# Altium project Control-Boards-v2.0.PrjPcb (part 8 of 10)

## Sheet Buttons-Lights-Sensors-Sheet.SchDoc
size 420 x 297 mm; SheetNumber: 12; SheetTotal: 15
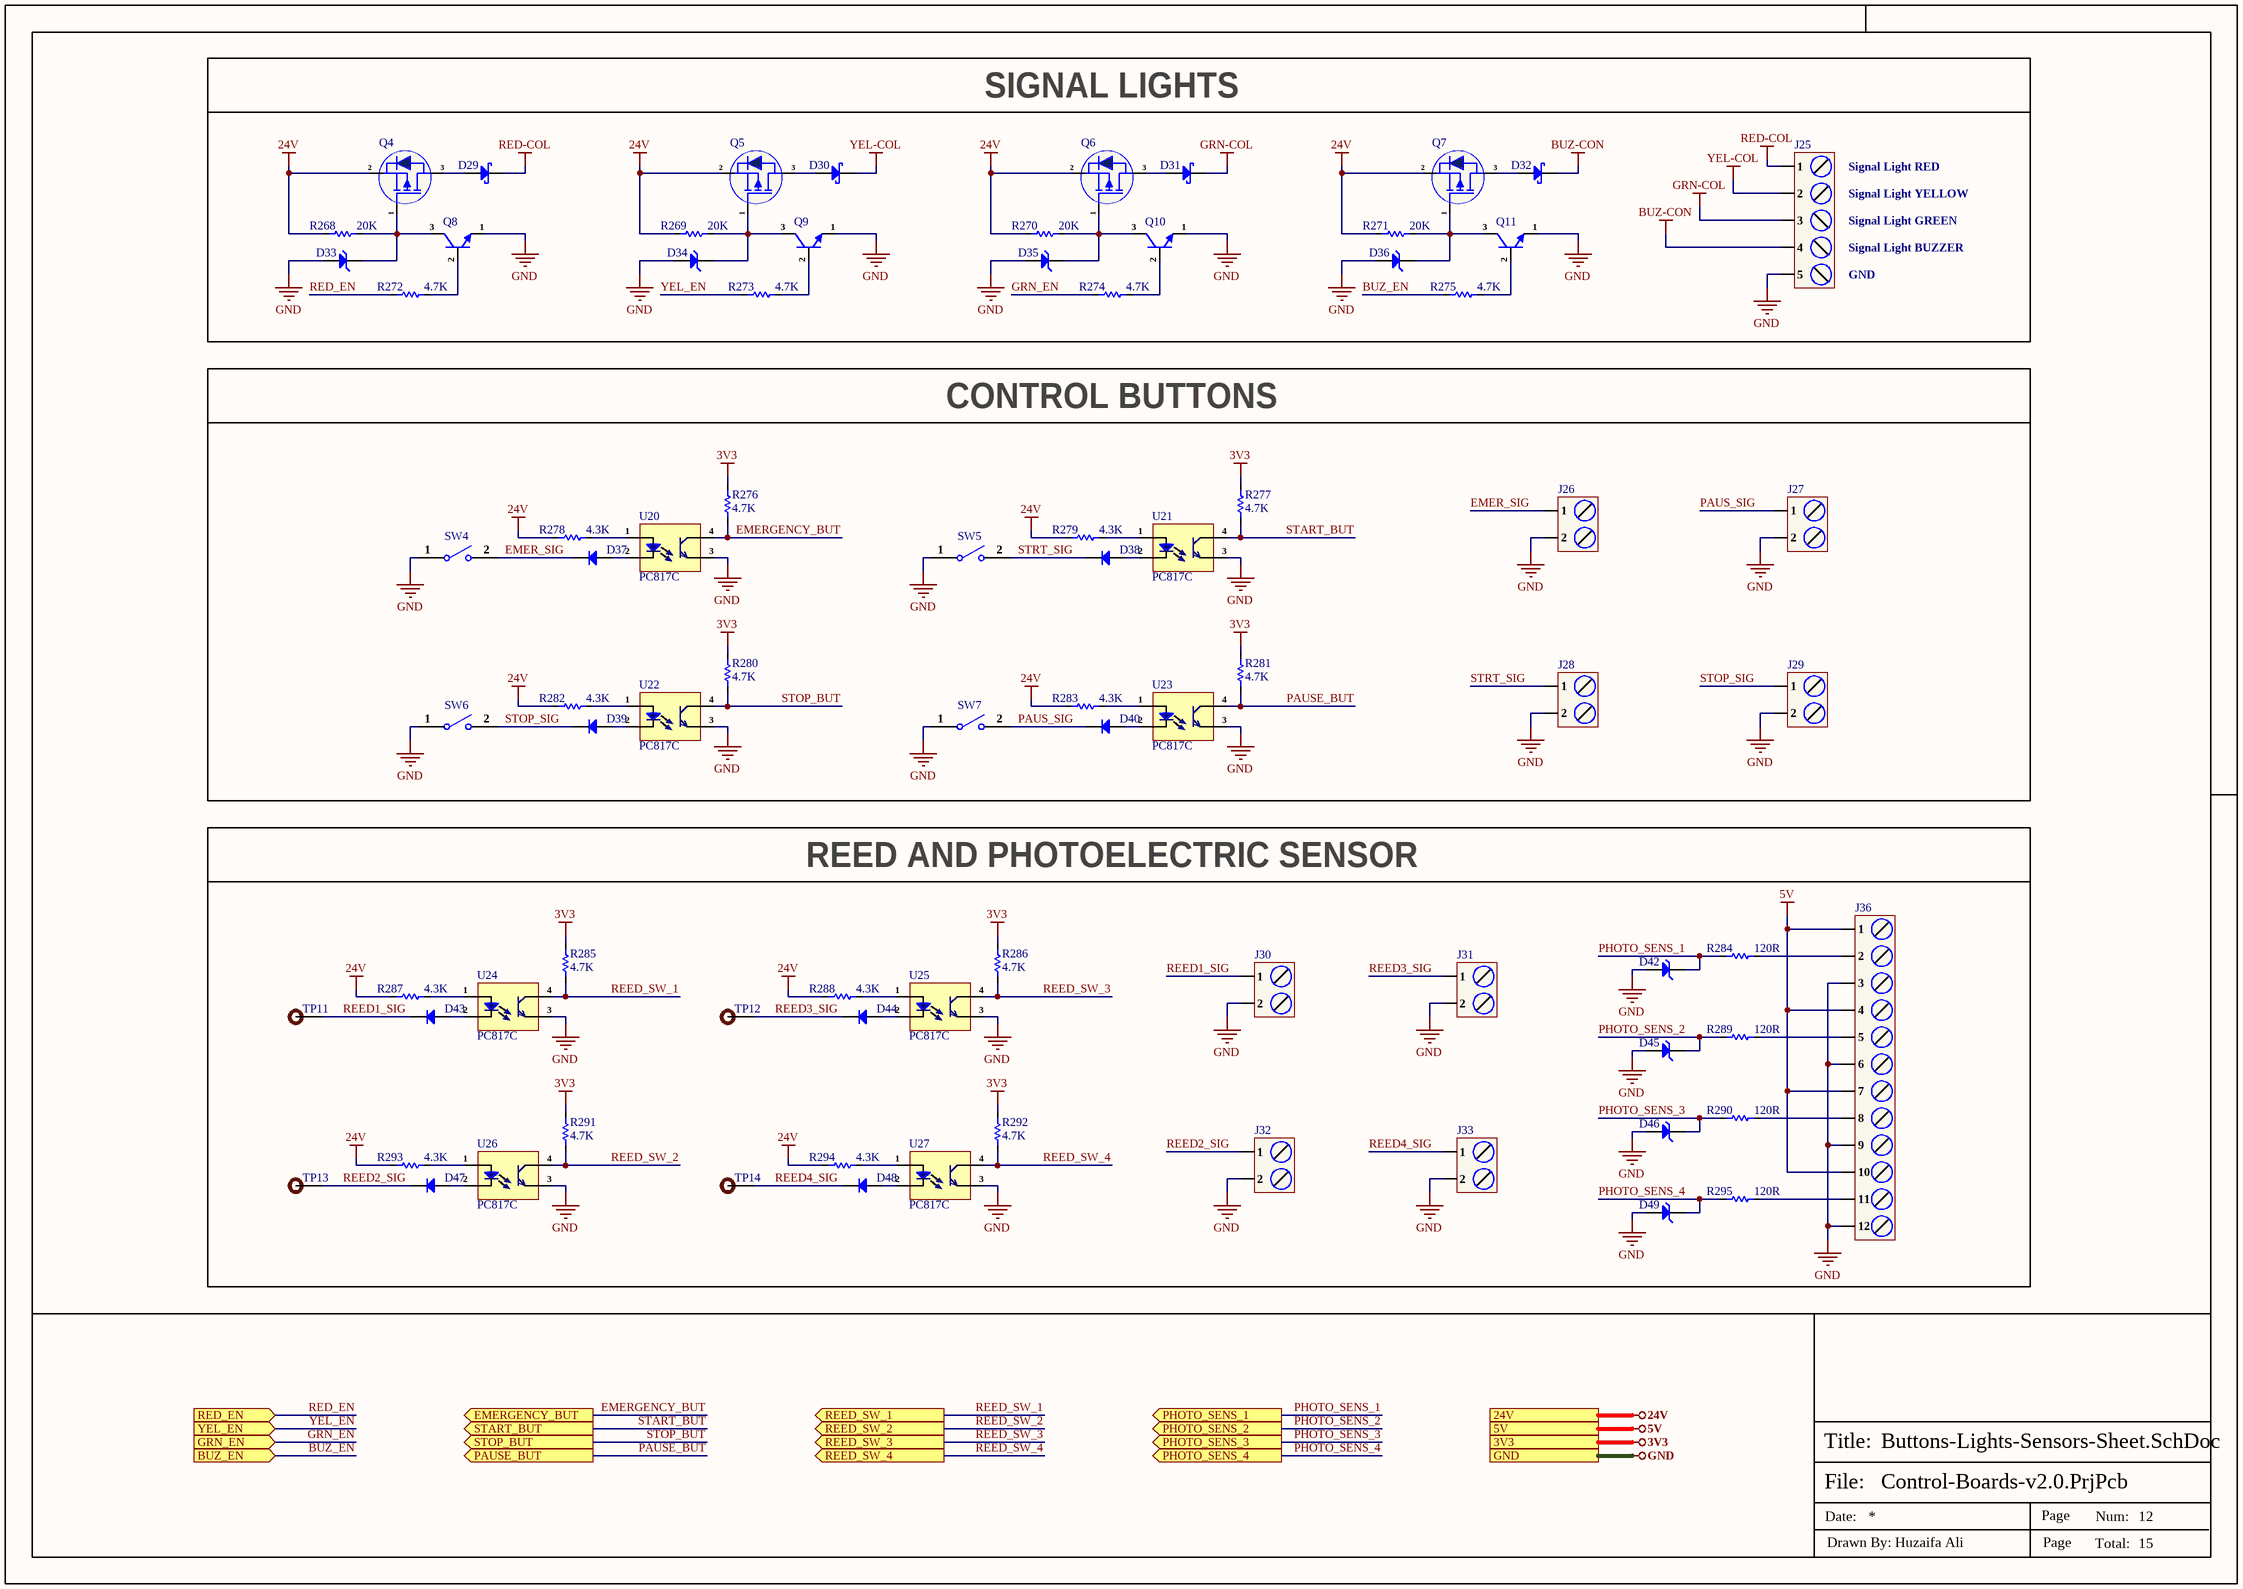
[diagram p12: Buttons-Lights-Sensors-Sheet.SchDoc]

### Parts
D29  SS16  [SMA]  (value not drawn)
D30  SS16  [SMA]  (value not drawn)
D31  SS16  [SMA]  (value not drawn)
D32  SS16  [SMA]  (value not drawn)
D33  1SMA5930BT3G  [SMA]  (value not drawn)
D34  1SMA5930BT3G  [SMA]  (value not drawn)
D35  1SMA5930BT3G  [SMA]  (value not drawn)
D36  1SMA5930BT3G  [SMA]  (value not drawn)
D37  1N4148W-7-F  [SOD-123]  (value not drawn)
D38  1N4148W-7-F  [SOD-123]  (value not drawn)
D39  1N4148W-7-F  [SOD-123]  (value not drawn)
D40  1N4148W-7-F  [SOD-123]  (value not drawn)
D42  MM3Z3V3B  [SOD323F]  (value not drawn)
D43  1N4148W-7-F  [SOD-123]  (value not drawn)
D44  1N4148W-7-F  [SOD-123]  (value not drawn)
D45  MM3Z3V3B  [SOD323F]  (value not drawn)
D46  MM3Z3V3B  [SOD323F]  (value not drawn)
D47  1N4148W-7-F  [SOD-123]  (value not drawn)
D48  1N4148W-7-F  [SOD-123]  (value not drawn)
D49  MM3Z3V3B  [SOD323F]  (value not drawn)
J25  DB128V-5.08-5P-GN-S  [DB128V-5.08-5P-GN-S]  (value not drawn)
J26  DB128L-5.08-2P-OG-S  [DB128L-5.08-2P-OG-S]  (value not drawn)
J27  DB128L-5.08-2P-GY-S  [DB128L-5.08-2P-GY-S]  (value not drawn)
J28  DB128L-5.08-2P-GN-S  [DB128L-5.08-2P-GN-S]  (value not drawn)
J29  DB128L-5.08-2P-BK-S  [DB128L-5.08-2P-BK-S]  (value not drawn)
J30  DB128L-5.08-2P-OG-S  [DB128L-5.08-2P-OG-S]  (value not drawn)
J31  DB128L-5.08-2P-GY-S  [DB128L-5.08-2P-GY-S]  (value not drawn)
J32  DB128L-5.08-2P-GN-S  [DB128L-5.08-2P-GN-S]  (value not drawn)
J33  DB128L-5.08-2P-BK-S  [DB128L-5.08-2P-BK-S]  (value not drawn)
J36  DB128V-5.08-12P-GN-S  [DB128V-5.08-12P-GN-S]  (value not drawn)
Q4  AO3401  [SOT-23]  (value not drawn)
Q5  AO3401  [SOT-23]  (value not drawn)
Q6  AO3401  [SOT-23]  (value not drawn)
Q7  AO3401  [SOT-23]  (value not drawn)
Q8  MMBT3904  [SOT-23]  (value not drawn)
Q9  MMBT3904  [SOT-23]  (value not drawn)
Q10  MMBT3904  [SOT-23]  (value not drawn)
Q11  MMBT3904  [SOT-23]  (value not drawn)
R268  20K  [Res-0402]
R269  20K  [Res-0402]
R270  20K  [Res-0402]
R271  20K  [Res-0402]
R272  4.7K  [Res-0402]
R273  4.7K  [Res-0402]
R274  4.7K  [Res-0402]
R275  4.7K  [Res-0402]
R276  4.7K  [Res-0402]
R277  4.7K  [Res-0402]
R278  4.3K  [Res-0402]
R279  4.3K  [Res-0402]
R280  4.7K  [Res-0402]
R281  4.7K  [Res-0402]
R282  4.3K  [Res-0402]
R283  4.3K  [Res-0402]
R284  120R  [Res-0603]
R285  4.7K  [Res-0402]
R286  4.7K  [Res-0402]
R287  4.3K  [Res-0402]
R288  4.3K  [Res-0402]
R289  120R  [Res-0603]
R290  120R  [Res-0603]
R291  4.7K  [Res-0402]
R292  4.7K  [Res-0402]
R293  4.3K  [Res-0402]
R294  4.3K  [Res-0402]
R295  120R  [Res-0603]
SW4  B3U-1000P  [B3U-1000P]  (value not drawn)
SW5  B3U-1000P  [B3U-1000P]  (value not drawn)
SW6  B3U-1000P  [B3U-1000P]  (value not drawn)
SW7  B3U-1000P  [B3U-1000P]  (value not drawn)
TP11  TEST POINT  [Test-point]  (value not drawn)  (no BOM)
TP12  TEST POINT  [Test-point]  (value not drawn)  (no BOM)
TP13  TEST POINT  [Test-point]  (value not drawn)  (no BOM)
TP14  TEST POINT  [Test-point]  (value not drawn)  (no BOM)
U20  PC817C  [PC817C]
U21  PC817C  [PC817C]
U22  PC817C  [PC817C]
U23  PC817C  [PC817C]
U24  PC817C  [PC817C]
U25  PC817C  [PC817C]
U26  PC817C  [PC817C]
U27  PC817C  [PC817C]

### Blocks framed on the sheet
SIGNAL LIGHTS: D29-D36 J25 Q4-Q11 R268-R275
CONTROL BUTTONS: D37-D40 J26-J29 R276-R283 SW4-SW7 U20-U23
REED AND PHOTOELECTRIC SENSOR: D42-D49 J30-J33 J36 R284-R295 TP11-TP14 U24-U27

### Ports
3V3 (see Top-Sheet[5B], CAN-Sheet[5D], Controller-Sheet-1[4D], Controller-Sheet-2[4D], EtherCAT-Sheet[1D], Ethernet-PHY-Sheet[4D], Power-Sheet[4D], RS232-Sheet[5D], RS485-Sheet[5D], USB-Sheet[4D], VFD-Support-Sheet[4D]), 5V (see Top-Sheet[5B], CAN-Sheet[5D], Controller-Sheet-2[4D], Power-Sheet[4D], RS232-Sheet[5D], RS485-Sheet[5D], USB-Sheet[4D], VFD-Support-Sheet[4D]), 24V (see Top-Sheet[5B], Power-Sheet[4D]), BUZ_EN (in, see Top-Sheet[5C]), EMERGENCY_BUT (out, see Top-Sheet[5C]), GND (see Top-Sheet[5C], CAN-Sheet[6D], Controller-Sheet-1[4D], Controller-Sheet-2[4D], Controller-Sheet-3[4D], EtherCAT-Sheet[1D], Ethernet-PHY-Sheet[4D], Extra-DIOs[4D], Power-Sheet[4D], RS232-Sheet[5D], RS485-Sheet[5D], USB-Sheet[4D], VFD-Support-Sheet2[4D], VFD-Support-Sheet[4D]), GRN_EN (in, see Top-Sheet[5C]), PAUSE_BUT (out, see Top-Sheet[5C]), PHOTO_SENS_1 (out, see Top-Sheet[5C]), PHOTO_SENS_2 (out, see Top-Sheet[5C]), PHOTO_SENS_3 (out, see Top-Sheet[5C]), PHOTO_SENS_4 (out, see Top-Sheet[5C]), RED_EN (in, see Top-Sheet[5C]), REED_SW_1 (out, see Top-Sheet[5C]), REED_SW_2 (out, see Top-Sheet[5C]), REED_SW_3 (out, see Top-Sheet[5C]), REED_SW_4 (out, see Top-Sheet[5C]), START_BUT (out, see Top-Sheet[5C]), STOP_BUT (out, see Top-Sheet[5C]), YEL_EN (in, see Top-Sheet[5C])

### Nets
3V3: R276.2 R277.2 R280.2 R281.2 R285.2 R286.2 R291.2 R292.2 ; port 3V3
5V: J36.1 J36.4 J36.7 J36.10 ; port 5V
24V: Q4.2(S) Q5.2(S) Q6.2(S) Q7.2(S) R268.1 R269.1 R270.1 R271.1 R278.1 R279.1 R282.1 R283.1 R287.1 R288.1 R293.1 R294.1 ; port 24V
BUZ-CON: D32.1(K) J25.4
GND: D33.2(A) D34.2(A) D35.2(A) D36.2(A) D42.1(A) D45.1(A) D46.1(A) D49.1(A) J25.5 J26.2 J27.2 J28.2 J29.2 J30.2 J31.2 J32.2 J33.2 J36.3 J36.6 J36.9 J36.12 Q8.1(E) Q9.1(E) Q10.1(E) Q11.1(E) SW4.1 SW5.1 SW6.1 SW7.1 U20.3(E) U21.3(E) U22.3(E) U23.3(E) U24.3(E) U25.3(E) U26.3(E) U27.3(E) ; port GND
GRN-COL: D31.1(K) J25.3
RED-COL: D29.1(K) J25.1
YEL-COL: D30.1(K) J25.2
BUZ_EN: R275.1 ; port BUZ_EN
EMER_SIG: D37.2(K) J26.1 SW4.2
EMERGENCY_BUT: R276.1 U20.4(C) ; port EMERGENCY_BUT  [project net DI_PE9]
GRN_EN: R274.1 ; port GRN_EN  [project net DO_PD14]
PAUS_SIG: D40.2(K) J27.1 SW7.2
PAUSE_BUT: R281.1 U23.4(C) ; port PAUSE_BUT  [project net DI_PE10]
PHOTO_SENS_1: D42.2(K) R284.1 ; port PHOTO_SENS_1  [project net DI_PG1]
PHOTO_SENS_2: D45.2(K) R289.1 ; port PHOTO_SENS_2  [project net DI_PG2]
PHOTO_SENS_3: D46.2(K) R290.1 ; port PHOTO_SENS_3  [project net DI_PG3]
PHOTO_SENS_4: D49.2(K) R295.1 ; port PHOTO_SENS_4  [project net DI_PG4]
RED_EN: R272.1 ; port RED_EN  [project net DO_PF13]
REED1_SIG: D43.2(K) J30.1 TP11.1
REED2_SIG: D47.2(K) J32.1 TP13.1
REED3_SIG: D44.2(K) J31.1 TP12.1
REED4_SIG: D48.2(K) J33.1 TP14.1
REED_SW_1: R285.1 U24.4(C) ; port REED_SW_1  [project net DI_PG0]
REED_SW_2: R291.1 U26.4(C) ; port REED_SW_2  [project net DI_PE13]
REED_SW_3: R286.1 U25.4(C) ; port REED_SW_3  [project net DI_PE14]
REED_SW_4: R292.1 U27.4(C) ; port REED_SW_4  [project net DI_PE15]
START_BUT: R277.1 U21.4(C) ; port START_BUT  [project net DI_PE7]
STOP_BUT: R280.1 U22.4(C) ; port STOP_BUT  [project net DI_PE8]
STOP_SIG: D39.2(K) J29.1 SW6.2
STRT_SIG: D38.2(K) J28.1 SW5.2
YEL_EN: R273.1 ; port YEL_EN  [project net DO_PD11]
NetD29_2: D29.2(A) Q4.3(D)
NetD30_2: D30.2(A) Q5.3(D)
NetD31_2: D31.2(A) Q6.3(D)
NetD32_2: D32.2(A) Q7.3(D)
NetD33_1: D33.1(K) Q4.1(G) Q8.3(C) R268.2
NetD34_1: D34.1(K) Q5.1(G) Q9.3(C) R269.2
NetD35_1: D35.1(K) Q6.1(G) Q10.3(C) R270.2
NetD36_1: D36.1(K) Q7.1(G) Q11.3(C) R271.2
NetD37_1: D37.1(A) U20.2(Ca)
NetD38_1: D38.1(A) U21.2(Ca)
NetD39_1: D39.1(A) U22.2(Ca)
NetD40_1: D40.1(A) U23.2(Ca)
NetD43_1: D43.1(A) U24.2(Ca)
NetD44_1: D44.1(A) U25.2(Ca)
NetD47_1: D47.1(A) U26.2(Ca)
NetD48_1: D48.1(A) U27.2(Ca)
NetJ36_2: J36.2 R284.2
NetJ36_5: J36.5 R289.2
NetJ36_8: J36.8 R290.2
NetJ36_11: J36.11 R295.2
NetQ8_2: Q8.2(B) R272.2
NetQ9_2: Q9.2(B) R273.2
NetQ10_2: Q10.2(B) R274.2
NetQ11_2: Q11.2(B) R275.2
NetR278_2: R278.2 U20.1(An)
NetR279_2: R279.2 U21.1(An)
NetR282_2: R282.2 U22.1(An)
NetR283_2: R283.2 U23.1(An)
NetR287_2: R287.2 U24.1(An)
NetR288_2: R288.2 U25.1(An)
NetR293_2: R293.2 U26.1(An)
NetR294_2: R294.2 U27.1(An)

### Notes on the sheet
- Signal Light RED
- Signal Light YELLOW
- Signal Light GREEN
- Signal Light BUZZER
- GND
- File:
- Title:
- Date:
- Page
- Num:
- Total:
- Drawn By: Huzaifa Ali

### Library data of the parts
D29-D32 = SS16: 60V 700mV@1A 1A SMA(DO-214AC) Schottky Barrier Diodes (SBD) ROHS; Manufacturer: MDD; Item Type: Schottky Diode; Manufacturer Part Number: SS16; Package: SMA(DO-214AC); LCSC Part Number: C2481; ComponentLink1Description: LCSC; ComponentLink1URL: https://www.lcsc.com/product-detail/Schottky-Barrier-Diodes-SBD_MDD-Microdiode-Electronics-SS16_C2481.html
D33-D36 = 1SMA5930BT3G: DIODE ZENER 16V 1.5W SMA; Manufacturer: onsemi; Item Type: Zener diode; Manufacturer Part Number: 1SMA5930BT3G; Package: SMA; LCSC Part Number: C128848; ComponentLink1Description: LCSC; ComponentLink1URL: https://www.lcsc.com/product-detail/Zener-Diodes_onsemi-1SMA5930BT3G_C128848.html
D37-D40 D43 D44 D47 D48 = 1N4148W-7-F: DIODE GEN PURP 100V 300MA SOD123; Manufacturer: Diodes; Forward Current: 150mA; Reverse Recovery Time: 4ns; Max Forward Surge Current (Ifsm): 2A; Element Configuration: Single; Max Reverse Current: 1uA; Forward Voltage: 1.25V; Power Dissipation: 400mW; Polarity: Standard; Voltage Rating (DC): 75V; Value: 2pF; Supplier 1: Future Electronics; Manufacturer Part Number: 1N4148W-7-F; RoHS: Yes; Category: Rectifier Diodes; Stock 1: 32931000; Pricing 1: 3000=0.01840, 12000=0.01760, 45000=0.01690, 120000=0.01640, 300000=0.01560 (USD); Mounting Technology: Surface Mount; Pins: 2; Weight: 0.000353oz; Contact Plating: Tin,Matte; Min Operating Temperature: -65°C; Max Operating Temperature: 150°C; Packaging: Tape and Reel; Max Repetitive Reverse Voltage (Vrrm): 100V; Peak Non-Repetitive Surge Current: 2A; Voltage: 100V; Max Surge Current: 2A; Package Quantity: 3000; Recovery Time: 4ns; Average Rectified Current: 300mA; Power Rating: 400mW; Current Rating: 150mA; Output Current: 150mA; Max Reverse Voltage (DC): 100V; Series: -; Reverse Recovery Time-Max: 4ns; Length: 2.85mm; Width: 1.7mm; Height: 1.25mm; Radiation Hardening: No; RoHS Compliant: Yes; Reach SVHC Compliant: Yes; Lead Free: Lead Free; ComponentLink1URL: https://datasheet.ciiva.com/1179/1915529-1179304.pdf?src-supplier=Element14; ComponentLink1Description: https://datasheet.ciiva.com/1179/1915529-1179304.pdf?src-supplier=Element14; ComponentLink2URL: https://datasheet.ciiva.com/22695/1915529-22695239.pdf?src-supplier=Element14; ComponentLink2Description: https://datasheet.ciiva.com/22695/1915529-22695239.pdf?src-supplier=Element14; ComponentLink3URL: https://datasheet.ciiva.com/8300/ds30086-8300392.pdf?src-supplier=Avnet; ComponentLink3Description: https://datasheet.ciiva.com/8300/ds30086-8300392.pdf?src-supplier=Avnet; ComponentLink4URL: https://datasheet.ciiva.com/15219/getdatasheetpartid-110030-15219548.pdf?src-supplier=Verical; ComponentLink4Description: https://datasheet.ciiva.com/15219/getdatasheetpartid-110030-15219548.pdf?src-supplier=Verical; ComponentLink5URL: https://datasheet.ciiva.com/8303/ds30086-8303197.pdf?src-supplier=Avnet; ComponentLink5Description: https://datasheet.ciiva.com/8303/ds30086-8303197.pdf?src-supplier=Avnet; ComponentLink6URL: https://datasheet.ciiva.com/911/ds30086-911735.pdf?src-supplier=Digi-Key; ComponentLink6Description: https://datasheet.ciiva.com/911/ds30086-911735.pdf?src-supplier=Digi-Key; ComponentLink7URL: https://datasheet.ciiva.com/911/ds30086-911736.pdf?src-supplier=Digi-Key; ComponentLink7Description: https://datasheet.ciiva.com/911/ds30086-911736.pdf?src-supplier=Digi-Key; ComponentLink8URL: https://datasheet.ciiva.com/911/ds30086-911734.pdf?src-supplier=Digi-Key; ComponentLink8Description: https://datasheet.ciiva.com/911/ds30086-911734.pdf?src-supplier=Digi-Key; ComponentLink9URL: https://datasheet.ciiva.com/4435/ds30086-4435128.pdf?src-supplier=Mouser; ComponentLink9Description: https://datasheet.ciiva.com/4435/ds30086-4435128.pdf?src-supplier=Mouser; Supplier Part Number 1: 7634694; LCSC Part Number: C83528; Item Type: Diode
D42 D45 D46 D49 = MM3Z3V3B: DIODE ZENER 3.3V 200MW SOD323F; Manufacturer: ON Semiconductor / Fairchild; Forward Voltage: 1V; Tolerance: 2%; Impedance: 89R; Max Reverse Leakage Current: 4.5uA; Test Current: 5mA; Element Configuration: Single; Supplier 1: Digi-Key; Manufacturer Part Number: MM3Z3V3B; Stock 1: 473644; Pricing 1: 1=0.22, 10=0.18, 100=0.0956, 500=0.06288, 1000=0.04276 (USD); Mount: Surface Mount; Number of Pins: 2; Weight: 0.0276g; Min Operating Temperature: -65°C; Max Operating Temperature: 150°C; Packaging: Tape and Reel; Package Quantity: 1; Max Power Dissipation: 200mW; Zener Voltage: 3.3V; Voltage Tolerance: 2%; Power Dissipation: 200mW; Working Voltage: 3.3V; Peak Reverse Current: 4.5uA; Length: 1.3mm; Height: 1mm; Width: 1.7mm; Radiation Hardening: No; REACH SVHC: No SVHC; Lead Free: Lead Free; ComponentLink1URL: http://www.onsemi.com/pub/Collateral/MM3Z9V1B-D.pdf?src-supplier=Digi-Key; ComponentLink1Description: http://www.onsemi.com/pub/Collateral/MM3Z9V1B-D.pdf?src-supplier=Digi-Key; ComponentLink2URL: http://www.mouser.com/ds/2/149/MM3Z3V3B-187166.pdf?src-supplier=Mouser; ComponentLink2Description: http://www.mouser.com/ds/2/149/MM3Z3V3B-187166.pdf?src-supplier=Mouser; ComponentLink3URL: https://www.fairchildsemi.com/datasheets/MM/MM3Z9V1B.pdf?src-supplier=Avnet; ComponentLink3Description: https://www.fairchildsemi.com/datasheets/MM/MM3Z9V1B.pdf?src-supplier=Avnet; ComponentLink4URL: http://www.farnell.com/datasheets/1706525.pdf?src-supplier=Element14; ComponentLink4Description: http://www.farnell.com/datasheets/1706525.pdf?src-supplier=Element14; Supplier Part Number 1: MM3Z3V3BCT-ND; LCSC Part Number: C2978865; Item Type: Diode
J25 = DB128V-5.08-5P-GN-S: 1x5P 20A -40℃~+105℃ 300V Green 12~30 Direct Insert 5.08mm 2.5 1 5 Plugin,P=5.08mm Screw Terminal Blocks ROHS; Manufacturer: DORABO; Manufacturer Part Number: DB128V-5.08-5P-GN-S; Package: Plugin,P=5.08mm; LCSC Part Number: C2927513; ComponentLink1Description: LCSC; ComponentLink1URL: https://www.lcsc.com/product-detail/Screw-Terminal-Blocks_DORABO-DB128V-5-08-5P-GN-S_C2927513.html; Item Type: Terminal Block
J26 J30 = DB128L-5.08-2P-OG-S: 1x2P 18A -40℃~+105℃ 250V Orange 12~30 Straight 5.08mm 2.5 1 2 Plugin,P=5.08mm Screw terminal ROHS; Manufacturer: DORABO; Item Type: Terminal Block; Manufacturer Part Number: DB128L-5.08-2P-OG-S; Package: Plugin,P=5.08mm; LCSC Part Number: C430603; ComponentLink1Description: LCSC; ComponentLink1URL: https://www.lcsc.com/product-detail/Screw-terminal_DORABO-DB128L-5-08-2P-OG-S_C430603.html
J27 J31 = DB128L-5.08-2P-GY-S: 1x2P 20A -40℃~+105℃ 300V Gray 12~30 Straight 5.08mm 1~2.5 1 2 Plugin,P=5.08mm Screw terminal ROHS; Manufacturer: DORABO; Item Type: Terminal Block; Manufacturer Part Number: DB128L-5.08-2P-GY-S; Package: Plugin,P=5.08mm; LCSC Part Number: C500021; ComponentLink1Description: LCSC; ComponentLink1URL: https://www.lcsc.com/product-detail/Screw-terminal_DORABO-DB128L-5-08-2P-GY-S_C500021.html
J28 J32 = DB128L-5.08-2P-GN-S: 1x2P 18A -40℃~+105℃ 250V Green 12~30 Straight 5.08mm 2.5 1 2 Plugin,P=5.08mm Screw terminal ROHS; Manufacturer: DORABO; Item Type: Terminal Block; Manufacturer Part Number: DB128L-5.08-2P-GN-S; Package: Plugin,P=5.08mm; LCSC Part Number: C395868; ComponentLink1Description: LCSC; ComponentLink1URL: https://www.lcsc.com/product-detail/Screw-terminal_DORABO-DB128L-5-08-2P-GN-S_C395868.html
J29 J33 = DB128L-5.08-2P-BK-S: 1x2P 18A -40℃~+105℃ 250V Black 12~30 Straight pin 5.08mm 2.5 1 2 Plugin,P=5.08mm Screw terminal ROHS; Manufacturer: DIBO; Item Type: Terminal Block; Manufacturer Part Number: DB128L-5.08-2P-BK-S; Package: Plugin,P=5.08mm; LCSC Part Number: C430601; ComponentLink1Description: LCSC; ComponentLink1URL: https://www.lcsc.com/product-detail/Screw-terminal_span-style-background-color-ff0-DIBO-span-DB128L-5-08-2P-BK-S_C430601.html
J36 = DB128V-5.08-12P-GN-S: 1x12P 20A -40℃~+105℃ 300V Green 12~30 Direct Insert 5.08mm 2.5 1 12 Plugin,P=5.08mm Screw Terminal Blocks ROHS; Manufacturer: DIBO; Manufacturer Part Number: DB128V-5.08-12P-GN-S; Package: Plugin,P=5.08mm; LCSC Part Number: C2927515; Item Type: Terminal Block; ComponentLink1Description: LCSC; ComponentLink1URL: https://www.lcsc.com/product-detail/Screw-Terminal-Blocks_DORABO-DB128V-5-08-12P-GN-S_C2927515.html
Q4-Q7 = AO3401: Trans Mosfet P-ch 30V 4A 3-PIN SOT-23 T/r; Manufacturer: Alpha & Omega Semiconductor; Manufacturer Part Number: AO3401A; Rds On Max: 44mR; Input Capacitance: 1.2nF; Max Power Dissipation: 1.4W; Number of Elements: 1; Supplier 1: Arrow Electronics; RoHS: Yes; Category: MOSFETs; Mount: Surface Mount; Case/Package: TO-236-3; Number of Pins: 3; Min Operating Temperature: -55°C; Max Operating Temperature: 150°C; Packaging: Tape and Reel; Drain to Source Voltage (Vdss): 30V; Continuous Drain Current (ID): 4A; Power Dissipation: 1.4W; Series: -; Radiation Hardening: No; RoHS Compliant: Yes; Lead Free: Lead Free; ComponentLink1URL: https://datasheet.ciiva.com/940/ao3401a-940720.pdf?src-supplier=Digi-Key; ComponentLink1Description: https://datasheet.ciiva.com/940/ao3401a-940720.pdf?src-supplier=Digi-Key; ComponentLink2URL: https://datasheet.ciiva.com/26927/getdatasheetpartid-79048-26927888.pdf?src-supplier=Verical; ComponentLink2Description: https://datasheet.ciiva.com/26927/getdatasheetpartid-79048-26927888.pdf?src-supplier=Verical; Supplier Part Number 1: AO3401A; LCSC Part Number: C181091; Item Type: Mosfet
Q8-Q11 = MMBT3904: 40V 200mW 100 200mA NPN SOT-23 Bipolar (BJT) ROHS; Manufacturer: ElecSuper; Item Type: (BJT); Manufacturer Part Number: MMBT3904; Package: SOT-23; LCSC Part Number: C5249683; ComponentLink1Description: LCSC; ComponentLink1URL: https://www.lcsc.com/product-detail/Bipolar-BJT_ElecSuper-MMBT3904_C5249683.html
R268-R271 = RC0402FR-0720KL: RES 20K OHM 1% 1/16W 0402; Manufacturer: Yageo; Resistance: 20kR; Power Rating: 62.5mW; Voltage Rating: 50V; Temperature Coefficient: 100ppm/°C; Max Power Dissipation: 63mW; Item Type: Resistor; Supplier 1: Avnet; Manufacturer Part Number: RC0402FR-0720KL; RoHS: Yes; Category: Chip SMD Resistors; Stock 1: 1960708; Pricing 1: 10000=0.00085 (USD); Case/Package: 0402; Number of Pins: 2; Case Code (Metric): 1005; Case Code (Imperial): 0402; Size Code: 0402; Min Operating Temperature: -55°C; Max Operating Temperature: 155°C; Tolerance: 1%; Package Quantity: 1; Packaging: Tape and Reel; Resistor Type: Thick Film; Number of Terminations: 2; Termination: SMD/SMT; Voltage Rating (DC): 50V; Features: Moisture Resistant; Series: RC; Technology: THICK FILM; Resistance Tolerance: 1%; Construction: Rectangular; Length: 1mm; Width: 0.02inch; Height: 0.016inch; Depth: 0.5mm; RoHS Compliant: Yes; Reach SVHC Compliant: Yes; Military Standard: Not; Lead Free: Lead Free; ComponentLink1URL: https://datasheet.ciiva.com/11808/0900766b80c66297-11808454.pdf?src-supplier=RSComponents; ComponentLink1Description: https://datasheet.ciiva.com/11808/0900766b80c66297-11808454.pdf?src-supplier=RSComponents; ComponentLink2URL: https://datasheet.ciiva.com/7983/1018594-7983511.pdf?src-supplier=Element14; ComponentLink2Description: https://datasheet.ciiva.com/7983/1018594-7983511.pdf?src-supplier=Element14; ComponentLink3URL: https://datasheet.ciiva.com/46394/1018594-46394974.pdf?src-supplier=Element14; ComponentLink3Description: https://datasheet.ciiva.com/46394/1018594-46394974.pdf?src-supplier=Element14; ComponentLink4URL: https://datasheet.ciiva.com/2453/pyu-r-int-thick-7-2453494.pdf?src-supplier=Digi-Key; ComponentLink4Description: https://datasheet.ciiva.com/2453/pyu-r-int-thick-7-2453494.pdf?src-supplier=Digi-Key; ComponentLink5URL: https://datasheet.ciiva.com/2453/pyu-r-int-thick-7-2453495.pdf?src-supplier=Digi-Key; ComponentLink5Description: https://datasheet.ciiva.com/2453/pyu-r-int-thick-7-2453495.pdf?src-supplier=Digi-Key; ComponentLink6URL: https://datasheet.ciiva.com/2453/pyu-r-int-thick-7-2453493.pdf?src-supplier=Digi-Key; ComponentLink6Description: https://datasheet.ciiva.com/2453/pyu-r-int-thick-7-2453493.pdf?src-supplier=Digi-Key; ComponentLink7URL: https://datasheet.ciiva.com/12558/pyu-rc0402-51-rohs-l-6-r-8721-12558796.pdf?src-supplier=Mouser; ComponentLink7Description: https://datasheet.ciiva.com/12558/pyu-rc0402-51-rohs-l-6-r-8721-12558796.pdf?src-supplier=Mouser; Supplier Part Number 1: RC0402FR-0720KL; LCSC Part Number: C93942
R272-R277 R280 R281 R285 R286 R291 R292 = RC0402FR-074K7L: RES 4.7K OHM 1% 1/16W 0402; Manufacturer: Yageo; Voltage Rating (DC): 50V; Power Rating: 62.5mW; Resistance: 4.7kR; Temperature Coefficient: 100ppm/°C; Max Power Dissipation: 63mW; Item Type: Resistor; Supplier 1: Avnet; Manufacturer Part Number: RC0402FR-074K7L; RoHS: Yes; Category: Chip SMD Resistors; Stock 1: 2420000; Pricing 1: 10000=0.00085 (USD); Case/Package: 0402; Number of Pins: 2; Case Code (Imperial): 0402; Case Code (Metric): 1005; Size Code: 0402; Min Operating Temperature: -55°C; Max Operating Temperature: 155°C; Tolerance: 1%; Voltage Rating: 50V; Packaging: Tape and Reel; Resistor Type: Thick Film; Termination: SMD/SMT; Features: Moisture Resistant; Series: RC; Number of Terminations: 2; Resistance Tolerance: 1%; Construction: Rectangular; Length: 1mm; Width: 0.5mm; Height: 0.32mm; Depth: 0.5mm; Height - Seated (Max): 0.016inch; RoHS Compliant: Yes; Reach SVHC Compliant: Yes; Military Standard: Not; Lead Free: Lead Free; ComponentLink1URL: https://datasheet.ciiva.com/22661/1686128-22661342.pdf?src-supplier=Element14; ComponentLink1Description: https://datasheet.ciiva.com/22661/1686128-22661342.pdf?src-supplier=Element14; ComponentLink2URL: https://datasheet.ciiva.com/7850/1018594-7850022.pdf?src-supplier=Element14; ComponentLink2Description: https://datasheet.ciiva.com/7850/1018594-7850022.pdf?src-supplier=Element14; ComponentLink3URL: https://datasheet.ciiva.com/7850/1018594-7850023.pdf?src-supplier=Element14; ComponentLink3Description: https://datasheet.ciiva.com/7850/1018594-7850023.pdf?src-supplier=Element14; ComponentLink4URL: https://datasheet.ciiva.com/15215/getdatasheetpartid-328119-15215035.pdf?src-supplier=Verical; ComponentLink4Description: https://datasheet.ciiva.com/15215/getdatasheetpartid-328119-15215035.pdf?src-supplier=Verical; Supplier Part Number 1: RC0402FR-074K7L; LCSC Part Number: C105871
R278 R279 R282 R283 R287 R288 R293 R294 = 0402WGF4301TCE: 62.5mW Thick Film Resistors 50V ±100ppm/℃ ±1% 4.3kΩ 0402 Chip Resistor - Surface Mount ROHS; Manufacturer: Royal Electronic Factory; Value: 4.3kR; Temperature Coefficient: 100ppm/°C; Supplier: Mouser; Supplier Part Number: 303-0402WGF4301TCE; Manufacturer Part Number: 0402WGF4301TCE; RoHS: No; Item Type: Resistor; Pricing: 10000=0.004 (USD); ComponentLink1URL: http://datasheet.octopart.com/0402WGF4301TCE-Royal-Ohm-datasheet-17591902.pdf?src-supplier=Mouser; ComponentLink1Description: http://datasheet.octopart.com/0402WGF4301TCE-Royal-Ohm-datasheet-17591902.pdf?src-supplier=Mouser; ComponentLink2URL: https://datasheet.octopart.com/0402WGF4301TCE-Royal-Ohm-datasheet-165785611.pdf?src-supplier=TME; ComponentLink2Description: https://datasheet.octopart.com/0402WGF4301TCE-Royal-Ohm-datasheet-165785611.pdf?src-supplier=TME; LCSC Part Number: C25899
R284 R289 R290 R295 = RC0603JR-07120RL: RES 120 OHM 5% 1/10W 0603; Manufacturer: Yageo; Voltage Rating (AC): 50V; Item Type: Resistor; Supplier: Future Electronics; Supplier Part Number: 4045720; Manufacturer Part Number: RC0603JR-07120RL; RoHS: Yes; Category: Chip SMD Resistors; Stock: 570000; Pricing: 5000=0.0015, 75000=0.0015, 250000=0.0014, 750000=0.0013, 2500000=0.0012 (USD); ComponentLink1URL: https://datasheet.ciiva.com/15189/getdatasheetpartid-326532-15189850.pdf?src-supplier=Verical; ComponentLink1Description: https://datasheet.ciiva.com/15189/getdatasheetpartid-326532-15189850.pdf?src-supplier=Verical; ComponentLink2URL: https://datasheet.ciiva.com/2518/pyu-r-int-thick-7-2518850.pdf?src-supplier=Digi-Key; ComponentLink2Description: https://datasheet.ciiva.com/2518/pyu-r-int-thick-7-2518850.pdf?src-supplier=Digi-Key; ComponentLink3URL: https://datasheet.ciiva.com/2518/pyu-r-int-thick-7-2518851.pdf?src-supplier=Digi-Key; ComponentLink3Description: https://datasheet.ciiva.com/2518/pyu-r-int-thick-7-2518851.pdf?src-supplier=Digi-Key; ComponentLink4URL: https://datasheet.ciiva.com/2518/pyu-r-int-thick-7-2518852.pdf?src-supplier=Digi-Key; ComponentLink4Description: https://datasheet.ciiva.com/2518/pyu-r-int-thick-7-2518852.pdf?src-supplier=Digi-Key; ComponentLink5URL: https://datasheet.ciiva.com/46395/443971-46395070.pdf?src-supplier=Element14; ComponentLink5Description: https://datasheet.ciiva.com/46395/443971-46395070.pdf?src-supplier=Element14; ComponentLink6URL: https://datasheet.ciiva.com/12555/rc0603-272842-12555246.pdf?src-supplier=Mouser; ComponentLink6Description: https://datasheet.ciiva.com/12555/rc0603-272842-12555246.pdf?src-supplier=Mouser; LCSC Part Number: C114681
SW4-SW7 = B3U-1000P: SWITCH TACTILE SPST-NO 0.05A 12V; Manufacturer: Omron; Mechanical Life: 200000Cycles; Operating Force: 1.5N; Throw Configuration: SPST; Current Rating: 50mA; Contact Resistance: 100mR; Illumination Type: Non-Illuminated,Illuminated; Switch Travel: 0.15mm; Switch Function: Off-Mom; Actuator Type: Standard; Actuator Length: 0.4mm; Ratings: Dust Proof,IP40; ComponentLink1URL: http://www.farnell.com/datasheets/60838.pdf?src-supplier=Farnell; ComponentLink1Description: http://www.farnell.com/datasheets/60838.pdf?src-supplier=Farnell; ComponentLink2URL: http://www.farnell.com/datasheets/60838.pdf?src-supplier=Element14; ComponentLink2Description: http://www.farnell.com/datasheets/60838.pdf?src-supplier=Element14; ComponentLink3URL: https://omronfs.omron.com/en_US/ecb/products/pdf/en-b3u.pdf?src-supplier=Digi-Key; ComponentLink3Description: https://omronfs.omron.com/en_US/ecb/products/pdf/en-b3u.pdf?src-supplier=Digi-Key; ComponentLink4URL: http://www.omron.com/ecb/products/pdf/en-b3u.pdf?src-supplier=Digi-Key; ComponentLink4Description: http://www.omron.com/ecb/products/pdf/en-b3u.pdf?src-supplier=Digi-Key; ComponentLink5URL: https://www.distrelec.biz/Web/Downloads/he/et/B3U_eng_datasheet.pdf?mime=application%2Fpdf&src-supplier=Distrelec; ComponentLink5Description: https://www.distrelec.biz/Web/Downloads/he/et/B3U_eng_datasheet.pdf?mime=application%2Fpdf&src-supplier=Distrelec; ComponentLink6URL: http://www.onlinecomponents.com/productFiles/mf-OM/en-b3u.pdf?src-supplier=Onlinecomponents.com; ComponentLink6Description: http://www.onlinecomponents.com/productFiles/mf-OM/en-b3u.pdf?src-supplier=Onlinecomponents.com; Supplier 1: Digi-Key; Manufacturer Part Number: B3U-1000P; Stock 1: 116454; Pricing 1: 1=1, 10=0.961, 25=0.9064, 50=0.7976, 100=0.7251, 250=0.68888, 500=0.67074, 1000=0.52571 (USD); Mount: Surface Mount; Weight: 0.000776oz; Contact Material: Silver; Min Operating Temperature: -25°C; Max Operating Temperature: 70°C; Packaging: Tape and Reel; Voltage Rating (DC): 12V; Package Quantity: 1; Max Current Rating: 50mA; Termination: SMD/SMT; Orientation: Straight; Max Voltage Rating (DC): 12V; Electrical Life: 200000Cycles; Insulation Resistance: 100MR; Contact Current Rating: 50mA; Length: 4mm; Height: 1.2mm; Depth: 2.5mm; Width: 3mm; REACH SVHC: Unknown; Lead Free: Lead Free; ComponentLink7URL: https://www.verical.com/server-webapp/html/getDatasheet?partID=552554&src-supplier=Verical; ComponentLink7Description: https://www.verical.com/server-webapp/html/getDatasheet?partID=552554&src-supplier=Verical; ComponentLink8URL: http://www.farnell.com/datasheets/1685550.pdf?src-supplier=Element14; ComponentLink8Description: http://www.farnell.com/datasheets/1685550.pdf?src-supplier=Element14; ComponentLink9URL: http://www.farnell.com/datasheets/2610940.pdf?src-supplier=Farnell; ComponentLink9Description: http://www.farnell.com/datasheets/2610940.pdf?src-supplier=Farnell; ComponentLink10URL: https://www.alliedelec.com/m/d/4c8a9ef82804fc3c241a13c1e298fd73.pdf?src-supplier=Allied+Electronics; ComponentLink10Description: https://www.alliedelec.com/m/d/4c8a9ef82804fc3c241a13c1e298fd73.pdf?src-supplier=Allied+Electronics; Supplier Part Number 1: SW1020DKR-ND; LCSC Part Number: C231329; Item Type: Switch
TP11-TP14 = TEST POINT: Test Point ON; Item Type: TEST POINT
U20-U27 = PC817C: 70V 5kV 50mA 100mV@1mA,20mA 1 6V 1.2V DC SMD-4 Transistor Output Optocoupler ROHS; Manufacturer: Slkor; Item Type: IC; Manufacturer Part Number: PC817C; Package: SMD-4; LCSC Part Number: C2936043; ComponentLink1Description: LCSC; ComponentLink1URL: https://www.lcsc.com/product-detail/Transistor-Output-Optocoupler_Slkor-SLKORMICRO-Elec-PC817C_C2936043.html

## Sheet VFD-Support-Sheet.SchDoc
size 420 x 297 mm; SheetNumber: 13; SheetTotal: 15
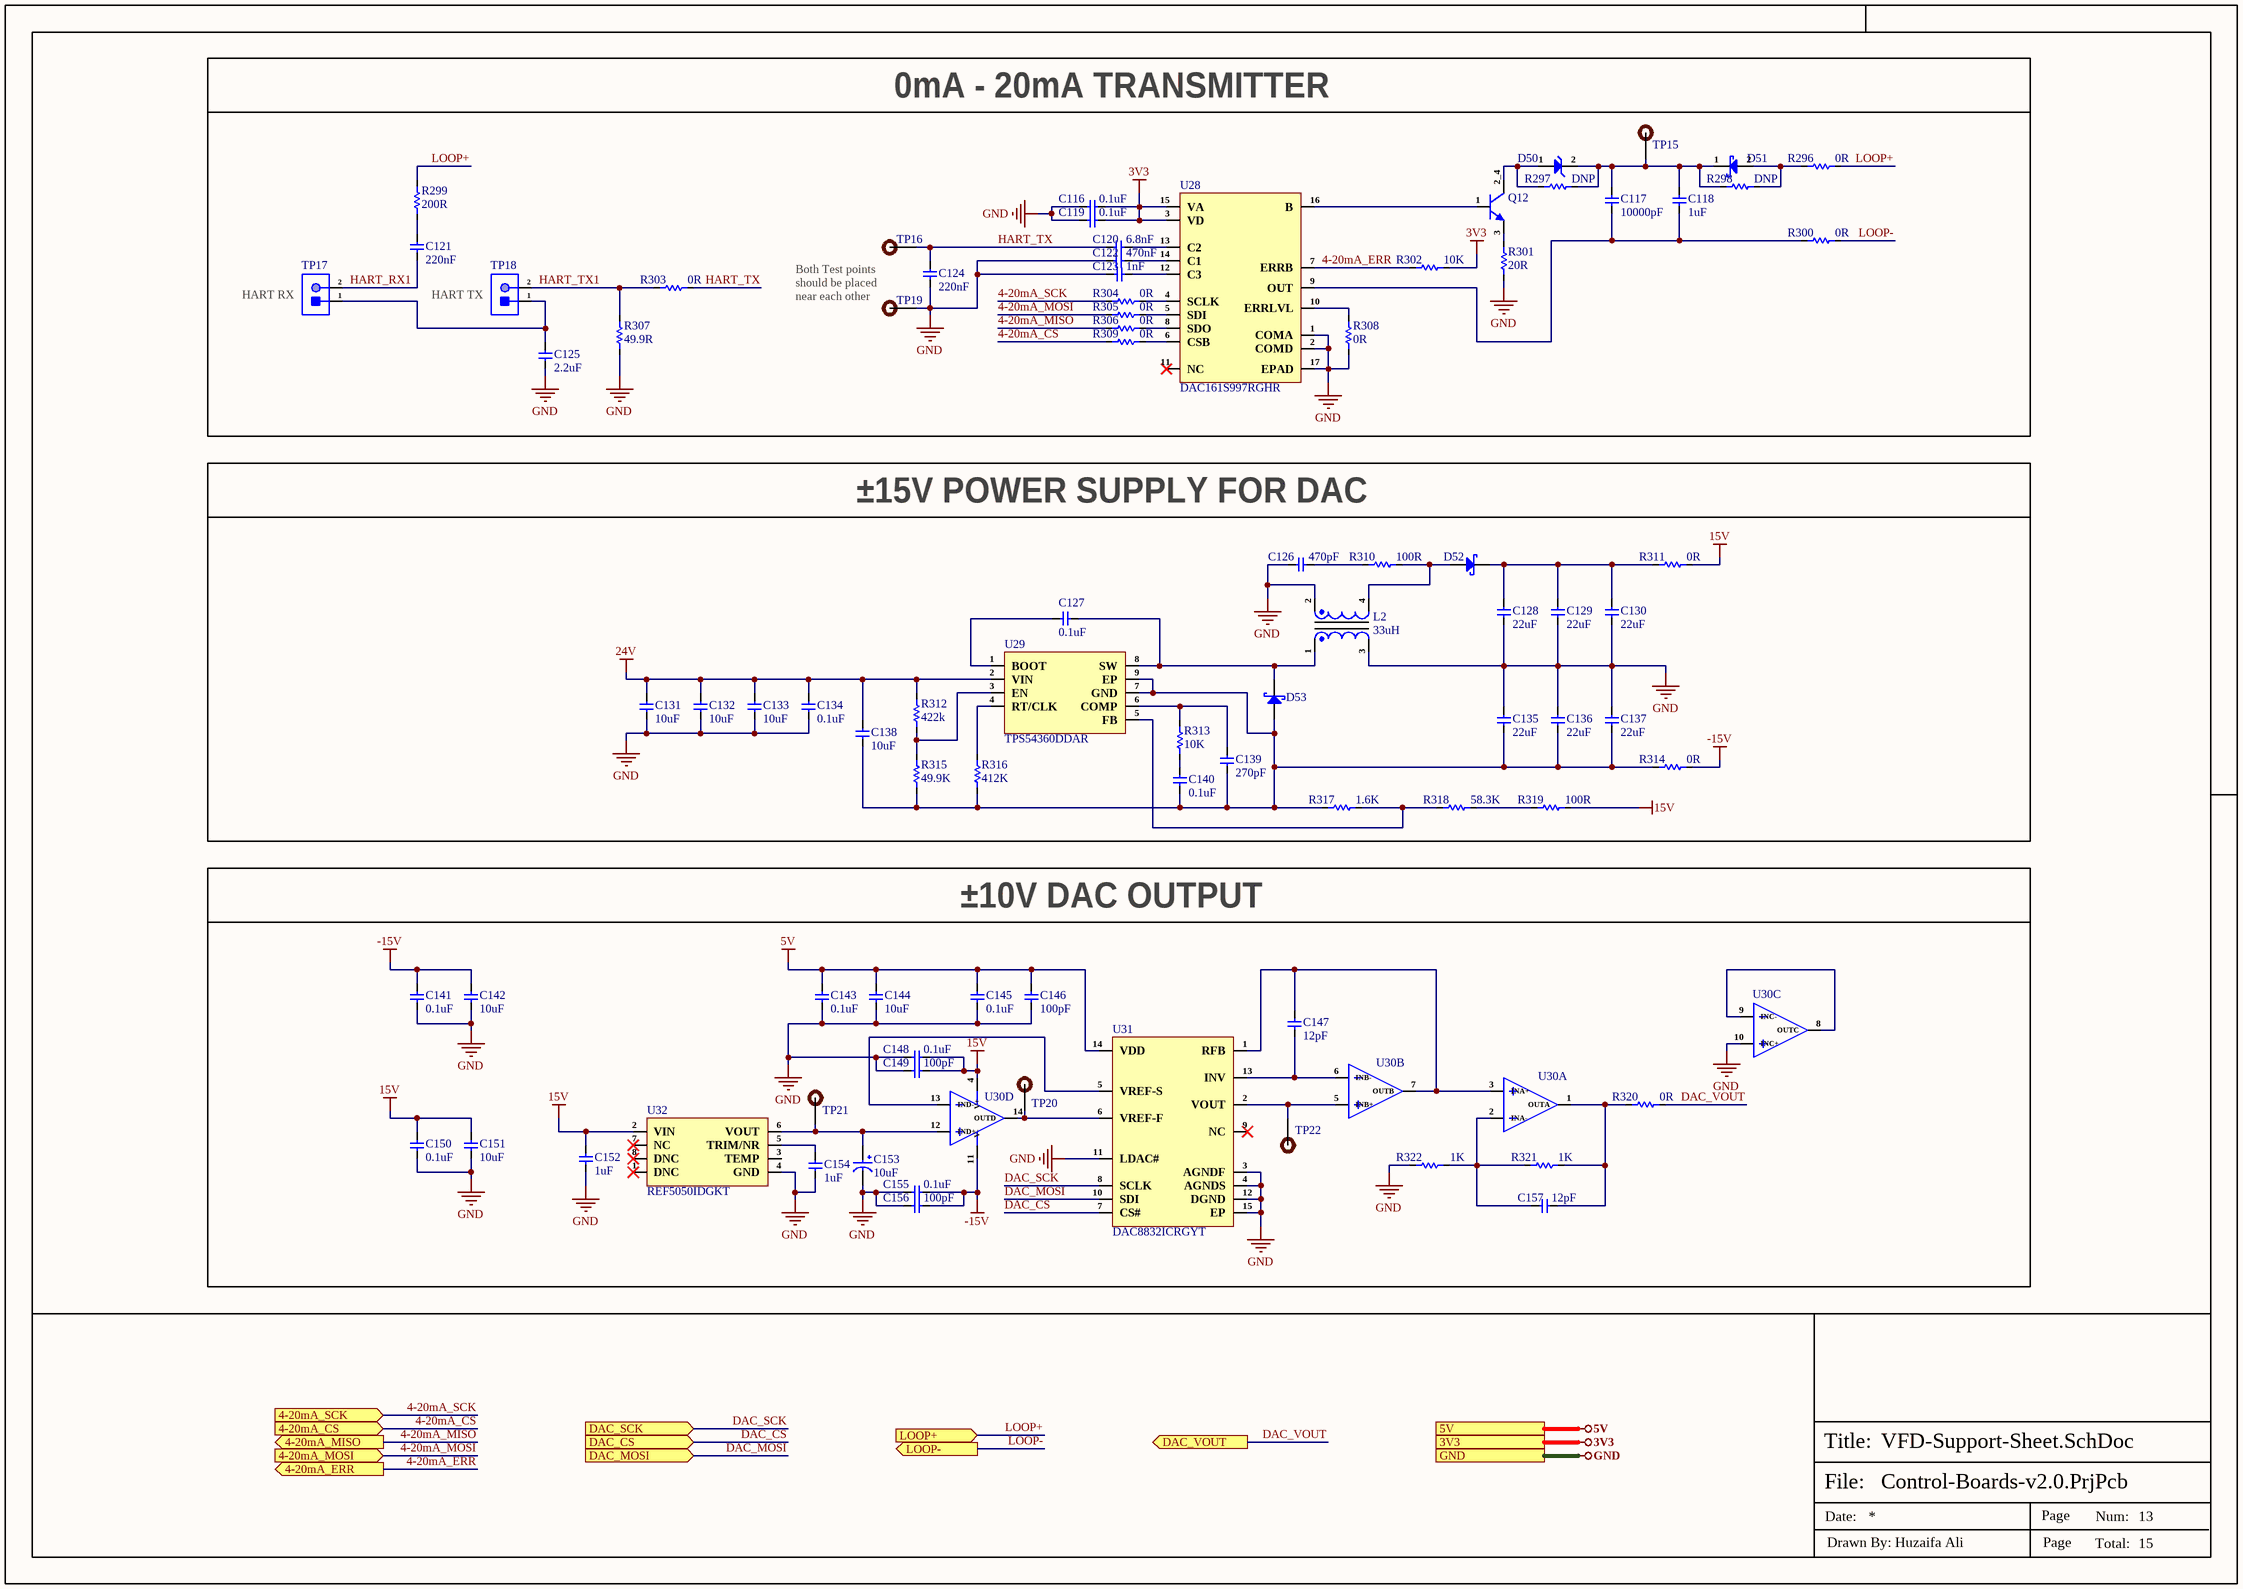
[diagram p13: VFD-Support-Sheet.SchDoc]

### Parts
C116  0.1uF  [Cap-0402]
C117  10000pF  [Cap-0603]
C118  1uF  [Cap-0603]
C119  0.1uF  [Cap-0402]
C120  6.8nF  [Cap-0603]
C121  220nF  [Cap-1206]
C122  470nF  [Cap-0603]
C123  1nF  [Cap-0402]
C124  220nF  [Cap-1206]
C125  2.2uF  [Cap-1206]
C126  470pF  [Cap-0603]
C127  0.1uF  [Cap-0603]
C128  22uF  [Cap-0805]
C129  22uF  [Cap-0805]
C130  22uF  [Cap-0805]
C131  10uF  [Cap-0805]
C132  10uF  [Cap-0805]
C133  10uF  [Cap-0805]
C134  0.1uF  [Cap-0603]
C135  22uF  [Cap-0805]
C136  22uF  [Cap-0805]
C137  22uF  [Cap-0805]
C138  10uF  [Cap-0805]
C139  270pF  [Cap-0402]
C140  0.1uF  [Cap-0603]
C141  0.1uF  [Cap-0603]
C142  10uF  [Cap-0805]
C143  0.1uF  [Cap-0603]
C144  10uF  [Cap-0805]
C145  0.1uF  [Cap-0603]
C146  100pF  [Cap-0402]
C147  12pF  [Cap-0402]
C148  0.1uF  [Cap-0603]
C149  100pF  [Cap-0402]
C150  0.1uF  [Cap-0603]
C151  10uF  [Cap-0805]
C152  1uF  [Cap-0603]
C153  10uF  [Case-C]
C154  1uF  [Cap-0603]
C155  0.1uF  [Cap-0603]
C156  100pF  [Cap-0402]
C157  12pF  [Cap-0402]
D50  3.9V  [SOD-123]  (value not drawn)
D51  B360A-13-F  [SMA(DO-214AC)]  (value not drawn)
D52  B360-13-F  [SMC]  (value not drawn)
D53  B360-13-F  [SMC]  (value not drawn)
L2  33uH  [MSD1278-333MLD]
Q12  PZT3904T1G  [PZT3904T1G]  (value not drawn)
R296  0R  [Res-0805]
R297  DNP  [Res-0805]
R298  DNP  [Res-0805]
R299  200R  [RES-0805]
R300  0R  [Res-0805]
R301  20R  [Res-0402]
R302  10K  [Res-0402]
R303  0R  [Res-0805]
R304  0R  [Res-0402]
R305  0R  [Res-0402]
R306  0R  [Res-0402]
R307  49.9R  [Res-0603]
R308  0R  [Res-0402]
R309  0R  [Res-0402]
R310  100R  [Res-0402]
R311  0R  [Res-0805]
R312  422k  [RES-0805]
R313  10K  [Res-0402]
R314  0R  [Res-0805]
R315  49.9K  [RES-0805]
R316  412K  [RES-0805]
R317  1.6K  [Res-0402]
R318  58.3K  [Res-0402]
R319  100R  [Res-0402]
R320  0R  [Res-0805]
R321  1K  [Res-0402]
R322  1K  [Res-0402]
TP15  TEST POINT  [Test-point]  (value not drawn)  (no BOM)
TP16  TEST POINT  [Test-point]  (value not drawn)  (no BOM)
TP17  2 Test Pad  [2 Test Pad]  (value not drawn)  (no BOM)
TP18  2 Test Pad  [2 Test Pad]  (value not drawn)  (no BOM)
TP19  TEST POINT  [Test-point]  (value not drawn)  (no BOM)
TP20  TEST POINT  [Test-point]  (value not drawn)  (no BOM)
TP21  TEST POINT  [Test-point]  (value not drawn)  (no BOM)
TP22  TEST POINT  [Test-point]  (value not drawn)  (no BOM)
U28  DAC161S997RGHR  [16-WQFN (4x4)]
U29  TPS54360DDAR  [8-SO PowerPad]
U30  OPA4192IPWR  [14-TSSOP]  (value not drawn)  (parts A,B,C,D of 4)
U31  DAC8832ICRGYT  [14-VQFN (3.5x3.5)]
U32  REF5050IDGKT  [VSSOP-8-0.65mm]

### Blocks framed on the sheet
0mA - 20mA TRANSMITTER: C116-C125 D50 D51 Q12 R296-R309 TP15-TP19 U28
±15V POWER SUPPLY FOR DAC: C126-C140 D52 D53 L2 R310-R319 U29
±10V DAC OUTPUT: C141-C157 R320-R322 TP20-TP22 U30-U32

### Ports
3V3 (see Top-Sheet[2D], Buttons-Lights-Sensors-Sheet[4D], CAN-Sheet[5D], Controller-Sheet-1[4D], Controller-Sheet-2[4D], EtherCAT-Sheet[1D], Ethernet-PHY-Sheet[4D], Power-Sheet[4D], RS232-Sheet[5D], RS485-Sheet[5D], USB-Sheet[4D]), 4-20mA_CS (in, see Top-Sheet[2D]), 4-20mA_ERR (out, see Top-Sheet[2D]), 4-20mA_MISO (out, see Top-Sheet[2D]), 4-20mA_MOSI (in, see Top-Sheet[2D]), 4-20mA_SCK (in, see Top-Sheet[2D]), 5V (see Top-Sheet[2D], Buttons-Lights-Sensors-Sheet[4D], CAN-Sheet[5D], Controller-Sheet-2[4D], Power-Sheet[4D], RS232-Sheet[5D], RS485-Sheet[5D], USB-Sheet[4D]), DAC_CS (in, see Top-Sheet[2D]), DAC_MOSI (in, see Top-Sheet[2D]), DAC_SCK (in, see Top-Sheet[2D]), DAC_VOUT (out, see Top-Sheet[2D], VFD-Support-Sheet2[3D]), GND (see Top-Sheet[2D], Buttons-Lights-Sensors-Sheet[4D], CAN-Sheet[6D], Controller-Sheet-1[4D], Controller-Sheet-2[4D], Controller-Sheet-3[4D], EtherCAT-Sheet[1D], Ethernet-PHY-Sheet[4D], Extra-DIOs[4D], Power-Sheet[4D], RS232-Sheet[5D], RS485-Sheet[5D], USB-Sheet[4D], VFD-Support-Sheet2[4D]), LOOP+ (in, see Top-Sheet[2D], VFD-Support-Sheet2[2D]), LOOP- (out, see Top-Sheet[2D], VFD-Support-Sheet2[2D])

### Nets
3V3: C116.1 C119.1 R302.2 U28.3(VD) U28.15(VA) ; port 3V3
5V: C143.2 C144.2 C145.2 C146.2 U31.14(VDD) ; port 5V
15V: C148.1 C149.1 C150.2 C151.2 C152.2 R311.2 R319.2 U30.4(V+) U32.2(VIN)
24V: C131.2 C132.2 C133.2 C134.2 C138.2 R312.2 U29.2(VIN)
-15V: C141.2 C142.2 C155.1 C156.1 R314.2 U30.11(V-)
GND: C116.2 C119.2 C122.1 C123.2 C124.2 C125.1 C126.1 C128.1 C129.1 C130.1 C131.1 C132.1 C133.1 C134.1 C135.2 C136.2 C137.2 C141.1 C142.1 C143.1 C144.1 C145.1 C146.1 C148.2 C149.2 C150.1 C151.1 C152.1 C153.2 C154.1 C155.2 C156.2 L2.2 L2.3 R301.1 R307.1 R308.2 R322.1 TP19.1 U28.1(COMA) U28.2(COMD) U28.17(EPAD) U30.10(INC+) U31.3(AGNDF) U31.4(AGNDS) U31.11(LDAC#) U31.12(DGND) U31.15(EP) U32.4(GND) ; port GND
4-20mA_CS: R309.1 ; port 4-20mA_CS
4-20mA_ERR: R302.1 U28.7(ERRB) ; port 4-20mA_ERR
4-20mA_MISO: R306.1 ; port 4-20mA_MISO
4-20mA_MOSI: R305.1 ; port 4-20mA_MOSI
4-20mA_SCK: R304.1 ; port 4-20mA_SCK
DAC_CS: U31.7(CS#) ; port DAC_CS
DAC_MOSI: U31.10(SDI) ; port DAC_MOSI
DAC_SCK: U31.8(SCLK) ; port DAC_SCK
DAC_VOUT: R320.2 ; port DAC_VOUT
HART_RX1: C121.2 TP17.2
HART_TX: C120.1 C124.1 R303.2 TP16.1
HART_TX1: R303.1 R307.2 TP18.2
LOOP+: R296.2 R299.2 ; port LOOP+
LOOP-: R300.2 ; port LOOP-
NetC117_1: C117.1 C118.1 R300.1 U28.9(OUT)
NetC117_2: C117.2 C118.2 D50.2(K) D51.1(K) R297.2 R298.1 TP15.1
NetC120_2: C120.2 U28.13(C2)
NetC121_1: C121.1 R299.1
NetC122_2: C122.2 U28.14(C1)
NetC123_1: C123.1 U28.12(C3)
NetC125_2: C125.2 TP17.1 TP18.1
NetC126_2: C126.2 R310.1
NetC127_1: C127.1 D53.1(K) L2.1 U29.8(SW)
NetC127_2: C127.2 U29.1(BOOT)
NetC128_2: C128.2 C129.2 C130.2 D52.1(K) R311.1
NetC135_1: C135.1 C136.1 C137.1 C138.1 C139.1 C140.2 D53.2(A) R314.1 R315.1 R316.1 R317.1 U29.7(GND) U29.9(EP)
NetC139_2: C139.2 R313.2 U29.6(COMP)
NetC140_1: C140.1 R313.1
NetC147_1: C147.1 U30.6(INB-) U31.13(INV)
NetC147_2: C147.2 U30.3(INA+) U30.7(OUTB) U31.1(RFB)
NetC153_1: C153.1 TP21.1 U30.12(IND+) U32.6(VOUT)
NetC154_2: C154.2 U32.5(TRIM/NR)
NetC157_1: C157.1 R320.1 R321.2 U30.1(OUTA)
NetC157_2: C157.2 R321.1 R322.2 U30.2(INA-)
NetD50_1: D50.1(A) Q12.2_4(C) R297.1
NetD51_2: D51.2(A) R296.1 R298.2
NetD52_2: D52.2(A) L2.4 R310.2
NetQ12_1: Q12.1(B) U28.16(B)
NetQ12_3: Q12.3(E) R301.2
NetR304_2: R304.2 U28.4(SCLK)
NetR305_2: R305.2 U28.5(SDI)
NetR306_2: R306.2 U28.8(SDO)
NetR308_1: R308.1 U28.10(ERRLVL)
NetR309_2: R309.2 U28.6(CSB)
NetR312_1: R312.1 R315.2 U29.3(EN)
NetR316_2: R316.2 U29.4(RT/CLK)
NetR317_2: R317.2 R318.1 U29.5(FB)
NetR318_2: R318.2 R319.1
NetTP20_1: TP20.1 U30.14(OUTD) U31.6(VREF-F)
NetTP22_1: TP22.1 U30.5(INB+) U31.2(VOUT)
NetU30_8: U30.8(OUTC) U30.9(INC-)
NetU30_13: U30.13(IND-) U31.5(VREF-S)

Not connected (* = marked no-connect by the designer): U28 11(NC)*; U31 9(NC)*; U32 1(DNC)* 3(TEMP) 7(NC)* 8(DNC)*

### Notes on the sheet
- (near TP17) HART RX
- HART TX
- Both Test points should be placed near each other
- File:
- Title:
- Date:
- Page
- Num:
- Total:
- Drawn By: Huzaifa Ali